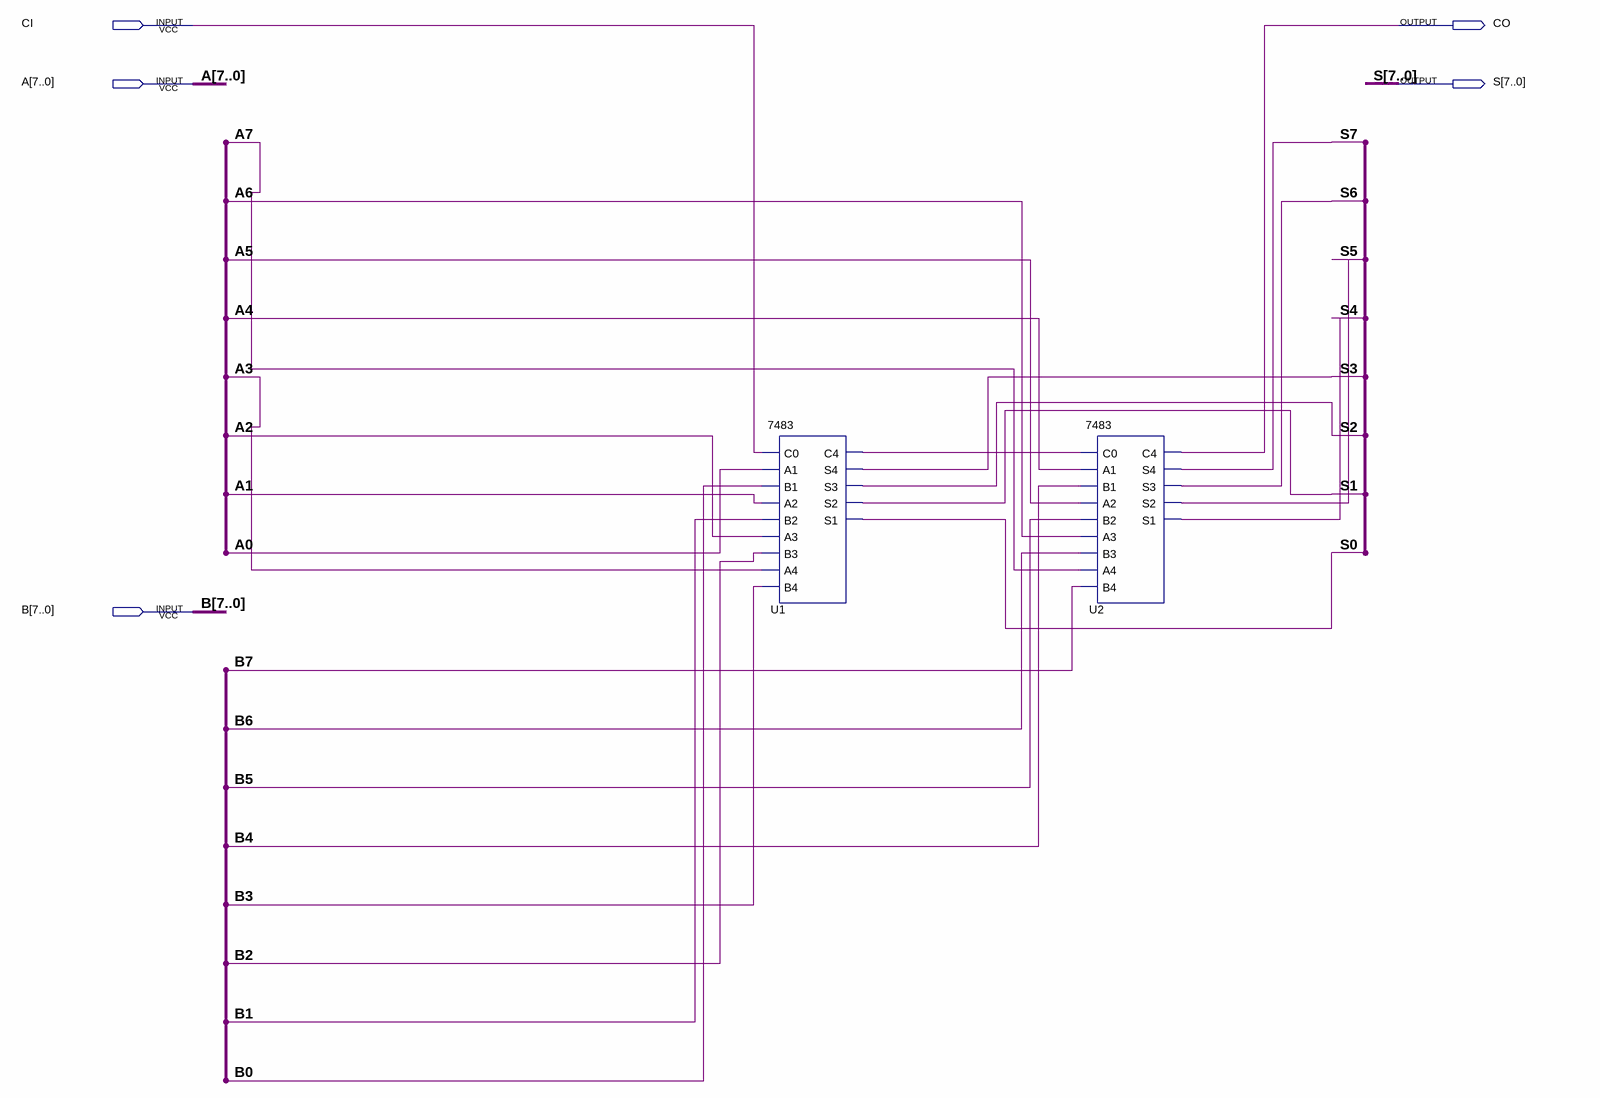
[diagram p0: schematic sheet]
// Quartus schematic add8.bdf as structural Verilog: 2 symbols, 5 pins
module add8 (
  input  CI,
  input  [7:0] A,
  input  [7:0] B,
  output CO,
  output [7:0] S
);

  wire U1_c4;

  \7483  U1 (
    .C0(CI), .A1(A[0]), .B1(B[0]), .A2(A[1]), .B2(B[1]), .A3(A[2]), .B3(B[2]), .A4(A[3]), .B4(B[3]),
    .C4(U1_c4), .S4(S[3]), .S3(S[2]), .S2(S[1]), .S1(S[0]));
  \7483  U2 (
    .C0(U1_c4), .A1(A[4]), .B1(B[4]), .A2(A[5]), .B2(B[5]), .A3(A[6]), .B3(B[6]), .A4(A[7]), .B4(B[7]),
    .C4(CO), .S4(S[7]), .S3(S[6]), .S2(S[5]), .S1(S[4]));
endmodule
